# Altium schematic sheet External_ir_receiver.SchDoc
size A4; SheetNumber: 1; SheetTotal: 1
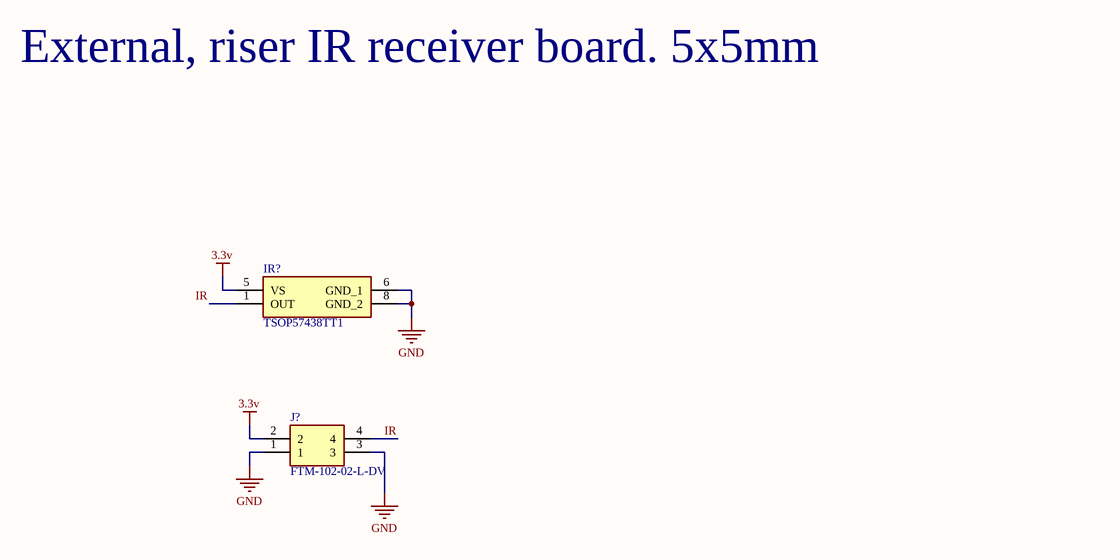
[diagram p0: External_ir_receiver.SchDoc]

## Parts
IR?  TSOP57438TT1  [TSOP57438TT1]
J?  FTM-102-02-L-DV  [FTM-102-XX-Y-DV]

## Nets
3.3v: IR?.5(VS) J?.2
GND: IR?.6(GND_1) IR?.8(GND_2) J?.1 J?.3
IR: IR?.1(OUT) J?.4

## Notes on the sheet
- External, riser IR receiver board. 5x5mm

## Library data of the parts
IR? = TSOP57438TT1: IR Reciever 38kHz 4x4mm; Manufacturer_Name: Vishay; Datasheet Link: http://www.vishay.com/docs/82434/tsop572.pdf; Height: 0.8mm; Manufacturer_Part_Number: TSOP57438TT1; Mouser Part Number: 78-TSOP57438TT1; Mouser Price/Stock: https://www.mouser.co.uk/ProductDetail/Vishay-Semiconductors/TSOP57438TT1?qs=irVir877As%252B0kVjtr547ig%3D%3D; Arrow Part Number: TSOP57438TT1; Arrow Price/Stock: https://www.arrow.com/en/products/tsop57438tt1/vishay?region=nac
J? = FTM-102-02-L-DV: Connector; Manufacturer_Name: SAMTEC; Datasheet Link: http://suddendocs.samtec.com/prints/ftm-1xx-xx-xx-dv-xx-mkt.pdf; Manufacturer_Part_Number: FTM-102-02-L-DV; Mouser Part Number: 200-FTM10202LDV; Mouser Price/Stock: https://www.mouser.co.uk/ProductDetail/Samtec/FTM-102-02-L-DV?qs=0lQeLiL1qya6YPCmM89DGQ%3D%3D; Arrow Part Number: FTM-102-02-L-DV; Arrow Price/Stock: https://www.arrow.com/en/products/ftm-102-02-l-dv/samtec?region=nac